# Altium schematic sheet LORA_V1.0.SchDoc
size A4; SheetNumber: 1; SheetTotal: 1
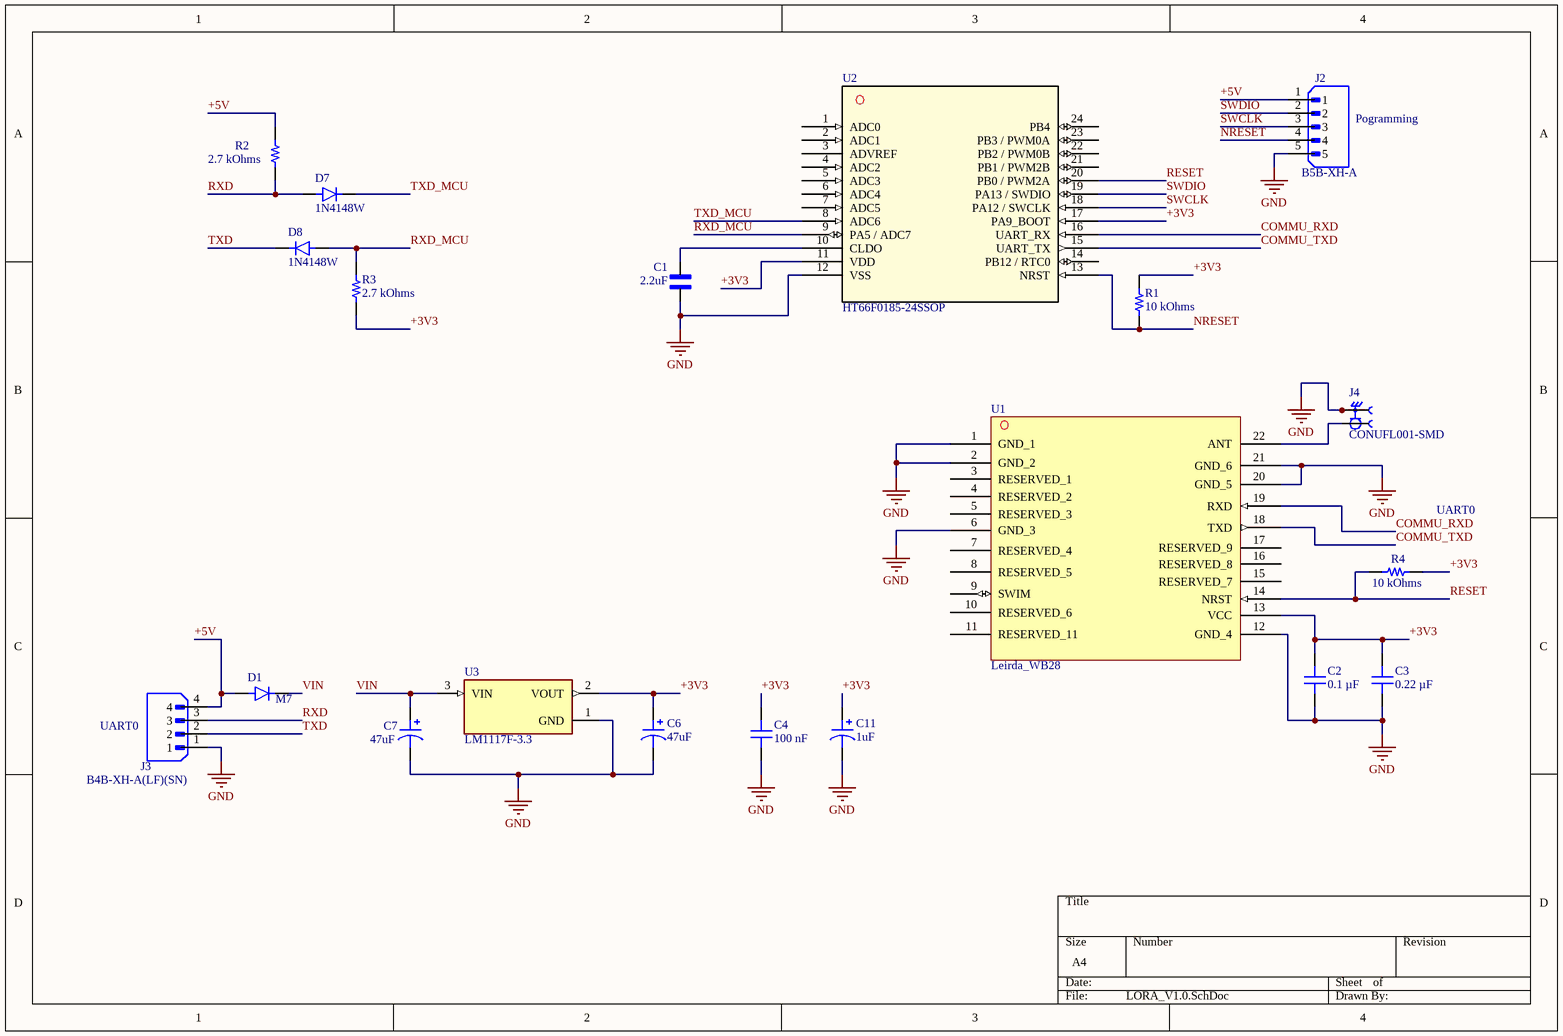
[diagram p0: LORA_V1.0.SchDoc]

## Parts
C1  2.2uF  [CAPC1608X90]
C2  Capacitance: 0.1 µF  [CAP 0603_1608]  (hidden comment: 0.1uF)
C3  Capacitance: 0.22 µF  [CAP 0603_1608]  (hidden comment: 22uF)
C4  Capacitance: 100 nF  [CAP 0603_1608]  (hidden comment: 100nF)
C6  47uF  [CAP TH ALUM ELEC D6.30mm S2.50mm H12.00mm]
C7  47uF  [CAP TH ALUM ELEC D6.30mm S2.50mm H12.00mm]
C11  1uF  [CAP TH ALUM ELEC D6.30mm S2.50mm H12.00mm]
D1  M7  [DIO_M7]
D7  1N4148W  [SODFL3816X120N]
D8  1N4148W  [SODFL3816X120N]
J2  B5B-XH-A  [JST_B5B-XH-A]
J3  B4B-XH-A(LF)(SN)  [JST_B4B-XH-A(LF)(SN)]
J4  CONUFL001-SMD  [LINX_CONUFL001-SMD]
R1  value 10 kOhms  [RES 0603_1608]  (hidden comment: 10K)
R2  value 2.7 kOhms  [RES 0603_1608]  (hidden comment: 2.7K)
R3  value 2.7 kOhms  [RES 0603_1608]  (hidden comment: 2.7K)
R4  value 10 kOhms  [RES 0603_1608]  (hidden comment: 10K)
U1  Leirda_WB28  [LCCS127P1800X2200X290-22N]
U2  HT66F0185-24SSOP  [SSOP24_150MIL_HLT]
U3  LM1117F-3.3  [VREG_LM1117F-3.3]

## Nets
GND: C1.2 C2.1 C3.1 C4.1 C6.2 C7.2 C11.2 J2.5 J3.1 J4.2 J4.3 U1.1(GND_1) U1.2(GND_2) U1.6(GND_3) U1.12(GND_4) U1.20(GND_5) U1.21(GND_6) U2.12(VSS) U3.1(GND)
+3V3: C2.2 C3.2 C4.2 C6.1 C11.1 R1.2 R3.1 R4.1 U1.13(VCC) U2.11(VDD) U2.17(PA9_BOOT) U3.2(VOUT)
+5V: D1.A J2.1 J3.4 R2.2
COMMU_RXD: U1.19(RXD) U2.16(UART_RX)
COMMU_TXD: U1.18(TXD) U2.15(UART_TX)
NRESET: J2.4 R1.1 U2.13(NRST)
RESET: R4.2 U1.14(NRST) U2.20(PB0_/_PWM2A)
RXD: D7.A J3.3 R2.1
RXD_MCU: D8.A R3.2 U2.9(PA5_/_ADC7)
SWCLK: J2.3 U2.18(PA12_/_SWCLK)
SWDIO: J2.2 U2.19(PA13_/_SWDIO)
TXD: D8.C(K) J3.2
TXD_MCU: D7.C(K) U2.8(ADC6)
VIN: C7.1 D1.C(K) U3.3(VIN)
NetC1_1: C1.1 U2.10(CLDO)
NetJ4_1: J4.1 U1.22(ANT)

Not connected (* = marked no-connect by the designer): U1 3(RESERVED_1) 4(RESERVED_2) 5(RESERVED_3) 7(RESERVED_4) 8(RESERVED_5) 9(SWIM) 10(RESERVED_6) 11(RESERVED_11) 15(RESERVED_7) 16(RESERVED_8) 17(RESERVED_9); U2 1(ADC0) 2(ADC1) 3(ADVREF) 4(ADC2) 5(ADC3) 6(ADC4) 7(ADC5) 14(PB12_/_RTC0) 21(PB1_/_PWM2B) 22(PB2_/_PWM0B) 23(PB3_/_PWM0A) 24(PB4)

## Notes on the sheet
- (near J2) Pogramming
- UART0
- (near J3) UART0

## Library data of the parts
C1 = CC0603KRX7R8BB105: 1 ÂµF Â±10% 25V Ceramic Capacitor X7R 0603 (1608 Metric); MF: Yageo; SnapEDA_Link: https://www.snapeda.com/parts/CC0603KRX7R8BB105/Yageo/view-part/?ref=snap; Package: 0603 Yageo; 2.2uF: *; MP: CC0603KRX7R8BB105; Check_prices: https://www.snapeda.com/parts/CC0603KRX7R8BB105/Yageo/view-part/?ref=eda
C2 = CS0603KRX7R7BB104: CAP CER 0.1UF 16V X7R 0603; manufacturer: Yageo; Tolerance: ±10%; value: 0.1 µF; Part Number: CS0603KRX7R7BB104; Applications: Boardflex Sensitive; componentlink1description: Datasheet; componentlink1url: http://www.yageo.com/NewPortal/yageodocoutput?fileName=/pdf/MLCC/UPY-ST_NPOX7R_16V-to-3KV_5.pdf; componentlink2description: DigiKey Link; componentlink2url: https://www.digikey.com/en/products/detail/yageo/CS0603KRX7R7BB104/6097897; Device Package: 0603 (1608 Metric); Features: Soft Termination; lastupdated: 06-04-2026 19:23:52; Lifecycle Status: Active; Minimum Order: 1; Mounting Type: Surface Mount, MLCC; Operating Temperature: -55°C ~ 125°C; Package / Case: 0603 (1608 Metric); packaging: TapeAndReel; partid: 2286; Part Status: Active; price: 0.02; series: CS; Size / Dimension: 0.063" L x 0.031" W (1.60mm x 0.80mm); Supplier 1: DigiKey; Supplier Part Number 1: 311-3560-1-ND; Temperature Coefficient: X7R; Thickness (Max): 0.037" (0.95mm); Voltage - Rated: 16V
C3 = CC0603KRX7R8BB224: CAP CER 0.22UF 25V X7R 0603; manufacturer: Yageo; Tolerance: ±10%; value: 0.22 µF; Part Number: CC0603KRX7R8BB224; Applications: General Purpose; componentlink1description: Datasheet; componentlink1url: https://www.yageo.com/upload/media/product/productsearch/datasheet/mlcc/UPY-GPHC_X7R_6.3V-to-50V_18.pdf; componentlink2description: DigiKey Link; componentlink2url: https://www.digikey.com/en/products/detail/yageo/CC0603KRX7R8BB224/5195211; Device Package: 0603 (1608 Metric); lastupdated: 06-04-2026 19:23:53; Lifecycle Status: Active; Minimum Order: 1; Mounting Type: Surface Mount, MLCC; Operating Temperature: -55°C ~ 125°C; Package / Case: 0603 (1608 Metric); packaging: TapeAndReel; partid: 2214; Part Status: Active; price: 0.01; series: CC; Size / Dimension: 0.063" L x 0.031" W (1.60mm x 0.80mm); Supplier 1: DigiKey; Supplier Part Number 1: 311-1803-1-ND; Temperature Coefficient: X7R; Thickness (Max): 0.035" (0.90mm); Voltage - Rated: 25V
C4 = CL10E104KC8VPNC: CAP CER 100NF 100V X8L 0603; manufacturer: Samsung Electro-Mechanics; Tolerance: ±10%; value: 0.1 µF; Part Number: CL10E104KC8VPNC; Applications: Automotive; componentlink1description: Datasheet; componentlink1url: https://mm.digikey.com/Volume0/opasdata/d220001/medias/docus/5458/CL10E104KC8VPNC_Spec.pdf; componentlink2description: DigiKey Link; componentlink2url: https://www.digikey.com/en/products/detail/samsung-electro-mechanics/CL10E104KC8VPNC/20498486; Device Package: 0603 (1608 Metric); Features: General Purpose; lastupdated: 06-04-2026 19:18:46; Lifecycle Status: Active; Minimum Order: 1; Mounting Type: Surface Mount, MLCC, Epoxy; Operating Temperature: -55°C ~ 150°C; Package / Case: 0603 (1608 Metric); packaging: TapeAndReel; partid: 68845; price: 0.04; Ratings: AEC-Q200; series: CL; Size / Dimension: 0.063" L x 0.031" W (1.60mm x 0.80mm); Supplier 1: DigiKey; Supplier Part Number 1: 1276-CL10E104KC8VPNCCT-ND; Temperature Coefficient: X8L; Thickness (Max): 0.035" (0.88mm); Voltage - Rated: 100V
C6 C7 = UKL1E470KEDANA: CAP ALUM 47UF 10% 25V RADIAL; manufacturer: Nichicon; Capacitance: 47µF; Lifetime @ Temp.: 1000 Hrs @ 105°C; Polarization: Polar; Ripple Current @ High Frequency: 340mA @ 10kHz; Ripple Current @ Low Frequency: 170mA @ 120Hz; value: 47µF; Part Number: UKL1E470KEDANA; Applications: General Purpose; componentlink1description: Datasheet; componentlink1url: http://nichicon-us.com/english/products/pdfs/e-ukl.pdf; componentlink2description: DigiKey Link; componentlink2url: http://digikey.com/product-detail/en/nichicon/UKL1E470KEDANA/493-15368-ND/2598433; Device Package: Radial, Can; Height - Seated (Max): 0.472" (12.00mm); lastupdated: 04-09-2020 01:05:44; Lead Spacing: 0.098" (2.50mm); Lifecycle Status: Active; Minimum Order: 1; Mounting Type: Through Hole; Operating Temperature: -40°C ~ 105°C; Package / Case: Radial, Can; packaging: Bulk; partid: 20077; Part Status: Active; price: 0.48; series: UKL; Size / Dimension: 0.248" Dia (6.30mm); Supplier 1: DigiKey; Supplier Part Number 1: 493-15368-ND; Tolerance: ±10%; Voltage - Rated: 25V
C11 = UKL1E470KEDANA: CAP ALUM 47UF 10% 25V RADIAL; Part Number: UKL1E470KEDANA
D1 = M7: MF: {'manufacturer': u'Diotec Semiconductor'}; Package: None; Price: None; Value: *; MP: M7; Availability: Unavailable
D7 D8 = 1N4148W: Small Signal Diode, SOD-123F, 100V, 0.15A, 150Â°C; MF: Diotec Semiconductor; SnapEDA_Link: https://www.snapeda.com/parts/1N4148W/Diotec/view-part/?ref=snap; Package: SOD-123F Diotec; Value: *; MP: 1N4148W; Check_prices: https://www.snapeda.com/parts/1N4148W/Diotec/view-part/?ref=eda
J2 = B5B-XH-A: Connector Header Through Hole 5 position 0.098 (2.50mm); MF: JST Sales; SnapEDA_Link: https://www.snapeda.com/parts/B5B-XH-A/JST+Sales+America+Inc./view-part/?ref=snap; Package: None; Value: *; MP: B5B-XH-A; Check_prices: https://www.snapeda.com/parts/B5B-XH-A/JST+Sales+America+Inc./view-part/?ref=eda
J3 = B4B-XH-A(LF)(SN): Connector Header Through Hole 4 position 0.098 (2.50mm); MF: JST Sales; SnapEDA_Link: https://www.snapeda.com/parts/B4B-XH-A(LF)(SN)/JST+Sales+America+Inc./view-part/?ref=snap; Package: None; Value: *; MP: B4B-XH-A(LF)(SN); Check_prices: https://www.snapeda.com/parts/B4B-XH-A(LF)(SN)/JST+Sales+America+Inc./view-part/?ref=eda
J4 = CONUFL001-SMD: MF: Linx; Availability: In Stock; Price: None; SnapEDA_Link: https://www.snapeda.com/parts/CONUFL001-SMD/Linx/view-part/5842340/?ref=snap; Value: *; Check_prices: https://www.snapeda.com/parts/CONUFL001-SMD/Linx/view-part/5842340/?ref=eda; MP: CONUFL001-SMD; Package: None
R1 R4 = CPF0603B10KE: RES SMD 10K OHM 0.1% 1/16W 0603; Manufacturer: TE Connectivity Passive Product; Power (Watts): 0.063W, 1/16W; Temperature Coefficient: ±25ppm/°C; Part Number: CPF0603B10KE; ComponentLink1Description: Datasheet; ComponentLink1URL: https://www.te.com/commerce/DocumentDelivery/DDEController?Action=srchrtrv&DocNm=1773200&DocType=DS&DocLang=English; ComponentLink2Description: DigiKey Link; ComponentLink2URL: https://www.digikey.com/en/products/detail/te-connectivity-passive-product/CPF0603B10KE/2389826; Composition: Thin Film; Device Package: 0603 (1608 Metric); Height - Seated (Max): 0.022" (0.55mm); LastUpdated: 09-02-2024 20:43:37; Lifecycle Status: Active; Minimum Order: 1; Number of Terminations: 2; Operating Temperature: -55°C ~ 155°C; Package / Case: 0603 (1608 Metric); Packaging: TapeAndReel; PartId: 4872; Part Status: Active; Price: 0.09; Resistance: 10 kOhms; Series: CPF, Neohm; Size / Dimension: 0.061" L x 0.031" W (1.55mm x 0.80mm); Supplier 1: DigiKey; Supplier Part Number 1: A119886CT-ND; Supplier Device Package: 0603; Tolerance: ±0.1%
R2 R3 = ERA-3AEB272V: RES SMD 2.7K OHM 0.1% 1/10W 0603; Manufacturer: Panasonic Electronic Components; Power (Watts): 0.1W, 1/10W; Temperature Coefficient: ±25ppm/°C; Part Number: ERA-3AEB272V; ComponentLink1Description: Datasheet; ComponentLink1URL: https://industrial.panasonic.com/cdbs/www-data/pdf/RDM0000/AOA0000C307.pdf; ComponentLink2Description: DigiKey Link; ComponentLink2URL: https://www.digikey.com/en/products/detail/panasonic-electronic-components/ERA-3AEB272V/1465864; Composition: Thin Film; Device Package: 0603 (1608 Metric); Features: Automotive AEC-Q200; Height - Seated (Max): 0.022" (0.55mm); LastUpdated: 09-02-2024 20:43:34; Lifecycle Status: Active; Minimum Order: 1; Number of Terminations: 2; Operating Temperature: -55°C ~ 155°C; Package / Case: 0603 (1608 Metric); Packaging: TapeAndReel; PartId: 5556; Part Status: Active; Price: 0.03; Ratings: AEC-Q200; Resistance: 2.7 kOhms; Series: ERA-3A; Size / Dimension: 0.063" L x 0.031" W (1.60mm x 0.80mm); Supplier 1: DigiKey; Supplier Part Number 1: P2.7KDBCT-ND; Supplier Device Package: 0603; Tolerance: ±0.1%
U2 = HT66F0185-24SSOP: Description; Manufacturer_Name: Holtek; Copyright: Copyright (C) 2025 Ultra Librarian. All rights reserved.; Manufacturer_Part_Number: HT66F0185-24SSOP; RefDes: RefDes; Type: Type
U3 = LM1117F-3.3: 1.0A LDO Fixed & Adjustable Voltage Regulator; MF: TAEJIN; SnapEDA_Link: https://www.snapeda.com/parts/LM1117F-3.3/TAEJIN/view-part/?ref=snap; Package: Package; Value: *; MP: LM1117F-3.3; Check_prices: https://www.snapeda.com/parts/LM1117F-3.3/TAEJIN/view-part/?ref=eda